# Altium schematic sheet Pressure_sensor_AFE1.SchDoc: =DT_SCH_Title
size A4; Organization: Droid Technologies; SheetNumber: 13; SheetTotal: 22
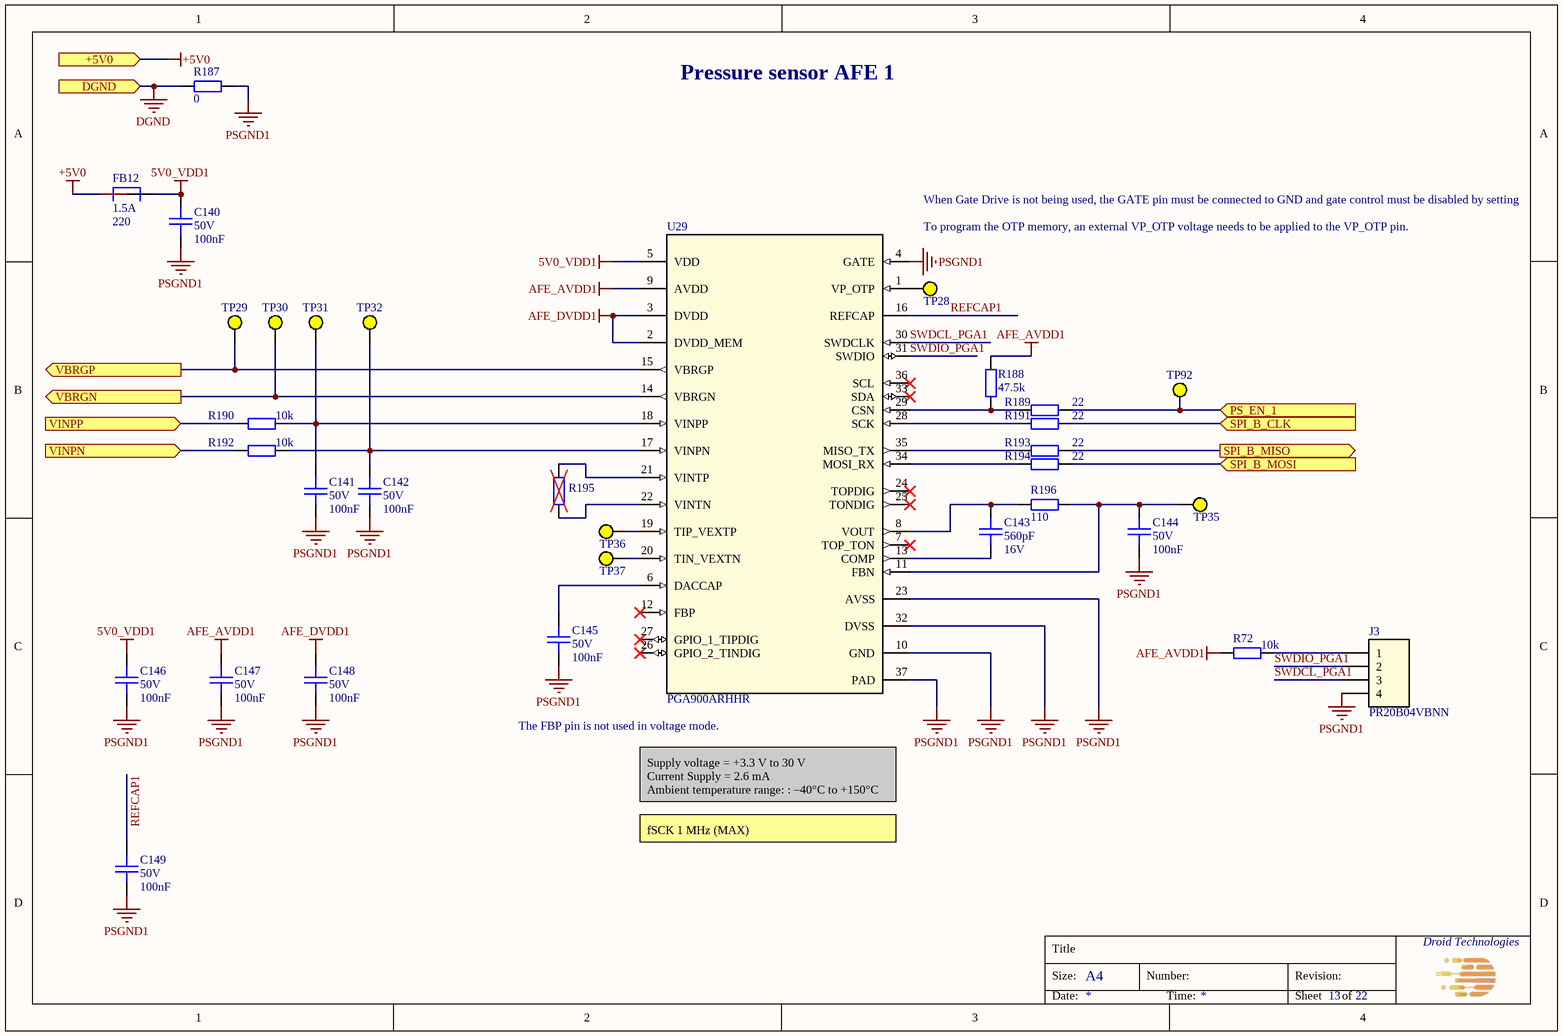
[diagram p0: Pressure_sensor_AFE1.SchDoc]

## Parts
C140  Voltage Rating: 50V  Capacitance: 100nF  [CAPC100x50x50L25]  (hidden comment: GCM155L8EH104KE07D)
C141  Voltage Rating: 50V  Capacitance: 100nF  [CAPC100x50x50L25]  (hidden comment: GCM155L8EH104KE07D)
C142  Voltage Rating: 50V  Capacitance: 100nF  [CAPC100x50x50L25]  (hidden comment: GCM155L8EH104KE07D)
C143  Capacitance: 560pF  Voltage Rating: 16V  [CAPC100x50x50L25]  (hidden comment: C0402C561F4HACAUTO)
C144  Voltage Rating: 50V  Capacitance: 100nF  [CAPC100x50x50L25]  (hidden comment: GCM155L8EH104KE07D)
C145  Voltage Rating: 50V  Capacitance: 100nF  [CAPC100x50x50L25]  (hidden comment: GCM155L8EH104KE07D)
C146  Voltage Rating: 50V  Capacitance: 100nF  [CAPC100x50x50L25]  (hidden comment: GCM155L8EH104KE07D)
C147  Voltage Rating: 50V  Capacitance: 100nF  [CAPC100x50x50L25]  (hidden comment: GCM155L8EH104KE07D)
C148  Voltage Rating: 50V  Capacitance: 100nF  [CAPC100x50x50L25]  (hidden comment: GCM155L8EH104KE07D)
C149  Voltage Rating: 50V  Capacitance: 100nF  [CAPC100x50x50L25]  (hidden comment: GCM155L8EH104KE07D)
FB12  Imax: 1.5A  Impedance: 220  [BEADC160X80X95L40]  (hidden comment: BLM18KG221BH1D)
J3  PR20B04VBNN  [M50-3530442]
R72  Resistance: 10k  [RESC100X50X40L25]  (hidden comment: RC0402FR-0710KL)
R187  Resistance: 0  [RESC160X80X55L30]  (hidden comment: RC0603FR-070RL)
R188  Resistance: 47.5k  [RESC100X50X40L25]  (hidden comment: RC0402FR-0747K5L)
R189  Resistance: 22  [RESC100X50X40L25]  (hidden comment: RC0402FR-0722RL)
R190  Resistance: 10k  [RESC100X50X40L25]  (hidden comment: RC0402FR-0710KL)
R191  Resistance: 22  [RESC100X50X40L25]  (hidden comment: RC0402FR-0722RL)
R192  Resistance: 10k  [RESC100X50X40L25]  (hidden comment: RC0402FR-0710KL)
R193  Resistance: 22  [RESC100X50X40L25]  (hidden comment: RC0402FR-0722RL)
R194  Resistance: 22  [RESC100X50X40L25]  (hidden comment: RC0402FR-0722RL)
R195  DNP chip res 0603  [RESC160X80X55L30]  (value not drawn)
R196  Resistance: 110  [RESC100X50X40L25]  (hidden comment: RC0402FR-07110RL)
TP28  Test Point  [TP_D1.5mm]  (value not drawn)  (no BOM)
TP29  Test Point  [TP_D0.75mm]  (value not drawn)  (no BOM)
TP30  Test Point  [TP_D0.75mm]  (value not drawn)  (no BOM)
TP31  Test Point  [TP_D0.75mm]  (value not drawn)  (no BOM)
TP32  Test Point  [TP_D0.75mm]  (value not drawn)  (no BOM)
TP35  Test Point  [TP_D0.75mm]  (value not drawn)  (no BOM)
TP36  Test Point  [TP_D1.5mm]  (value not drawn)  (no BOM)
TP37  Test Point  [TP_D1.5mm]  (value not drawn)  (no BOM)
TP92  Test Point  [TP_D0.75mm]  (value not drawn)  (no BOM)
U29  PGA900ARHHR  [36VQFN]

## Ports
+5V0 (in), DGND (in), PS_EN_1 (in), SPI_B_CLK (in), SPI_B_MISO (out), SPI_B_MOSI (in), VBRGN (out), VBRGP (out), VINPN (in), VINPP (in)

## Nets
5V0_VDD1: C140.2 C146.2 FB12.2 U29.5(VDD)
+5V0: FB12.1 ; port +5V0
AFE_AVDD1: C147.2 R72.2 R188.2 U29.9(AVDD)
AFE_DVDD1: C148.2 U29.2(DVDD_MEM) U29.3(DVDD)
DGND: R187.2 ; port DGND
PSGND1: C140.1 C141.1 C142.1 C144.1 C145.1 C146.1 C147.1 C148.1 C149.1 J3.4 R187.1 U29.4(GATE) U29.10(GND) U29.23(AVSS) U29.32(DVSS) U29.37(PAD)
PS_EN_1: R189.2 TP92.1 ; port PS_EN_1
REFCAP1: C149.2 U29.16(REFCAP)
SPI_B_CLK: R191.2 ; port SPI_B_CLK
SPI_B_MISO: R193.2 ; port SPI_B_MISO
SPI_B_MOSI: R194.2 ; port SPI_B_MOSI
SWDCL_PGA1: J3.3 U29.30(SWDCLK)
SWDIO_PGA1: J3.2 U29.31(SWDIO)
VBRGN: TP30.1 U29.14(VBRGN) ; port VBRGN
VBRGP: TP29.1 U29.15(VBRGP) ; port VBRGP
VINPN: R192.1 ; port VINPN
VINPP: R190.1 ; port VINPP
NetC141_2: C141.2 R190.2 TP31.1 U29.18(VINPP)
NetC142_2: C142.2 R192.2 TP32.1 U29.17(VINPN)
NetC143_1: C143.1 U29.13(COMP)
NetC143_2: C143.2 R196.1 U29.8(VOUT)
NetC144_2: C144.2 R196.2 TP35.1 U29.11(FBN)
NetC145_2: C145.2 U29.6(DACCAP)
NetJ3_1: J3.1 R72.1
NetR188_1: R188.1 R189.1 U29.29(CSN)
NetR191_1: R191.1 U29.28(SCK)
NetR193_1: R193.1 U29.35(MISO_TX)
NetR194_1: R194.1 U29.34(MOSI_RX)
NetR195_1: R195.1 U29.22(VINTN)
NetR195_2: R195.2 U29.21(VINTP)
NetTP28_1: TP28.1 U29.1(VP_OTP)
NetTP36_1: TP36.1 U29.19(TIP_VEXTP)
NetTP37_1: TP37.1 U29.20(TIN_VEXTN)

Not connected (* = marked no-connect by the designer): U29 7(TOP_TON)* 12(FBP)* 24(TOPDIG)* 25(TONDIG)* 26(GPIO_2_TINDIG)* 27(GPIO_1_TIPDIG)* 33(SDA)* 36(SCL)*

## Notes on the sheet
- Pressure sensor AFE 1
- To program the OTP memory, an external VP_OTP voltage needs to be applied to the VP_OTP pin.
- When Gate Drive is not being used, the GATE pin must be connected to GND and gate control must be disabled by setting
- (near U29) The FBP pin is not used in voltage mode.
- Supply voltage = +3.3 V to 30 V
  Current Supply = 2.6 mA
  Ambient temperature range: : –40°C to +150°C
- fSCK 1 MHz (MAX)
- Title
- Size:
- A4
- Number:
- Revision:
- Date:
- Time:
- Sheet
- of

## Library data of the parts
C140-C142 C144-C149 = CMP-001-1980-2: CAP CER 0.1UF 50V X8L 0402; Manufacturer: Murata Electronics; Op Temp max: 150°C; Op Temp min: -55°C; Tolerance: 10%; Height max: 550µm; ComponentLink3Description: Digikey; Mounting Type: SM; ComponentLink3URL: https://www.digikey.com/en/products/detail/murata-electronics/GCM155L8EH104KE07D/11618823; Package: 0402 (1005 Metric); Lead Spacing: 0mm; MPN: GCM155L8EH104KE07D; Size: 1.00mm x 0.50mm; Ratings: AEC-Q200; ComponentLink1URL: https://www.murata.com/en-us/products/productdetail?partno=GCM155L8EH104KE07%23; ComponentLink1Description: Datasheet; Dielectric: X8L; ComponentLink2Description: Mouser; ComponentLink2URL: https://eu.mouser.com/ProductDetail/Murata-Electronics/GCM155L8EH104KE07D?qs=1mbolxNpo8fQSHf0HYnZWw%3D%3D
C143 = CMP-001-2011-2: CAP CER 0402 560PF 16V ULTRA STA; Manufacturer: KEMET; Dielectric: X8R; Tolerance: 1%; Op Temp max: 150°C; Op Temp min: -55°C; Package: 0402 (1005 Metric); MPN: C0402C561F4HACAUTO; ComponentLink3Description: Digikey; Mounting Type: SM; Height max: 550µm; Lead Spacing: 0mm; ComponentLink1Description: Datasheet; ComponentLink3URL: https://www.digikey.com/en/products/detail/kemet/C0402C561F4HACAUTO/7955183?s=N4IgjCBcpgbFoDGUBmBDANgZwKYBoQB7KAbRAGYBOMAVgA4QBdAgBwBcoQBlNgJwEsAdgHMQAXwJgA7AhDJI6bPiKkQAFgBMGzfGYh2nHgJHiCGmhtnzFuAsUhltGyuQh6DkbnyGiJ4SnSUVqiYtioOIAAMTH4akWpB0HIhSnaqNLCRAAQsAGJMrByeAKqC-GwA8igAsjhoWACuvDimIAC0lknyfA3K9mQ0MbHpmSwoMUA; ComponentLink2URL: https://eu.mouser.com/ProductDetail/KEMET/C0402C561F4HACAUTO?qs=j%252B1pi9TdxUZljUlO6hXHJQ%3D%3D; ComponentLink2Description: Mouser; ComponentLink1URL: https://www.kemet.com/en/us/product/C0402C561F4HACAUTO.html; Ratings: AEC-Q200; Size: 1.00mm x 0.50mm
FB12 = CMP-001-1981-1: FERRITE BEAD 220 OHM 0603 1LN; Manufacturer: Murata Electronics; DCR: 50m; Op Temp min: -55°C; Frequency: 100MHz; Op Temp max: 150°C; Number of Lines: 1; Mounting Type: SM; Size: 1.60mm x 0.80mm; ComponentLink2URL: https://eu.mouser.com/ProductDetail/Murata-Electronics/BLM18KG221BH1D?qs=sJ5gq5MLFXpgEHYBdWUtkQ%3D%3D; ComponentLink1Description: Datasheet; ComponentLink1URL: https://www.murata.com/en-us/products/productdata/8798137286686/QNFA9129.pdf; Lead Spacing: 0mm; Ratings: AEC-Q200; ComponentLink3Description: Digikey; ComponentLink3URL: https://www.digikey.com/en/products/detail/murata-electronics/BLM18KG221BH1D/6156000; Height max: 950µm; Package: 0603 (1608 Metric); ComponentLink2Description: Mouser; MPN: BLM18KG221BH1D
J3 = M50-3530442: Connector Header Through Hole 4 position 0.050" (1.27mm); Manufacturer: METZ CONNECT USA Inc.; MPN: PR20B04VBNN; ComponentLink1Description: Datasheet; ComponentLink1URL: https://www.lcsc.com/datasheet/C3326047.pdf; ComponentLink2Description: DigiKey; ComponentLink2URL: https://www.digikey.com/en/products/detail/metz-connect-usa-inc/PR20B04VBNN/12342910
R72 R190 R192 = CMP-00010-6: RES 10K OHM 1% 1/16W 0402; Manufacturer: YAGEO; Op Temp max: 155°C; Op Temp min: -55°C; Power: 63mW; Temperature Coefficient: ±100ppm; ComponentLink3URL: https://www.digikey.com/en/products/detail/yageo/RC0402FR-0710KL/726523; ComponentLink1Description: Datasheet; Height max: 400µm; ComponentLink3Description: Digikey; ComponentLink2URL: https://www2.mouser.com/ProductDetail/YAGEO/RC0402FR-0710KL?qs=%2Fha2pyFaduhjtLcYvKXQ8NAGbRXkQ%2Fwl6RsvWHeV66MSeqLhkcF3rg%3D%3D; Ratings: -; MPN: RC0402FR-0710KL; ComponentLink1URL: https://www.yageo.com/upload/media/product/productsearch/datasheet/rchip/PYu-RC_Group_51_RoHS_L_12.pdf; ComponentLink2Description: Mouser; Mounting Type: SM; Tolerance: 1%; Composition: Thick Film; Size: 1.00mm x 0.50mm; Package: 0402 (1005 Metric)
R187 = CMP-001-0927-2: RES 0 OHM JUMPER 1/10W 0603; Manufacturer: YAGEO; Op Temp min: -55°C; Op Temp max: 155°C; Power: 100mW; Tolerance: 0%; Height max: 550µm; ComponentLink2URL: https://eu.mouser.com/ProductDetail/YAGEO/RC0603FR-070RL?qs=0yPvnVz5%2FmpDQv43TwvCfw%3D%3D; Temperature Coefficient: -; ComponentLink3Description: Digikey; ComponentLink2Description: Mouser; MPN: RC0603FR-070RL; ComponentLink1URL: https://www.yageo.com/upload/media/product/productsearch/datasheet/rchip/PYu-RC_Group_51_RoHS_L_12.pdf; Ratings: -; Size: 1.60mm x 0.80mm; Composition: Thick Film; Mounting Type: SM; ComponentLink3URL: https://www.digikey.com/en/products/detail/yageo/RC0603FR-070RL/1304008; Package: 0603 (1608 Metric); ComponentLink1Description: Datasheet
R188 = CMP-001-0277-7: RES 47.5K OHM 1% 1/16W 0402; Manufacturer: YAGEO; Op Temp min: -55°C; Power: 63mW; Temperature Coefficient: ±100ppm; Op Temp max: 155°C; ComponentLink1URL: https://www.yageo.com/upload/media/product/productsearch/datasheet/rchip/PYu-RC_Group_51_RoHS_L_12.pdf; ComponentLink1Description: Datasheet; MPN: RC0402FR-0747K5L; ComponentLink3Description: Digikey; ComponentLink2URL: https://eu.mouser.com/ProductDetail/YAGEO/RC0402FR-0747K5L?qs=V1yeUXFNrklfu86Rfgihxg%3D%3D; Mounting Type: SM; Tolerance: 1%; Package: 0402 (1005 Metric); Height max: 400µm; ComponentLink2Description: Mouser; ComponentLink3URL: https://www.digikey.com/en/products/detail/yageo/RC0402FR-0747K5L/726617; Size: 1.00mm x 0.50mm; Composition: Thick Film; Ratings: -
R189 R191 R193 R194 = CMP-001-0482-4: RES 22 OHM 1% 1/16W 0402; Manufacturer: YAGEO; Temperature Coefficient: ±100ppm; Op Temp max: 155°C; Op Temp min: -55°C; Power: 63mW; Ratings: -; ComponentLink3URL: https://www.digikey.com/en/products/detail/yageo/RC0402FR-0722RL/726562; ComponentLink2URL: https://eu.mouser.com/ProductDetail/YAGEO/RC0402FR-0722RL?qs=V1yeUXFNrkkRg6zf08ADKQ%3D%3D; MPN: RC0402FR-0722RL; ComponentLink1Description: Datasheet; ComponentLink3Description: Digikey; Tolerance: 1%; Size: 1.00mm x 0.50mm; ComponentLink1URL: https://www.yageo.com/upload/media/product/productsearch/datasheet/rchip/PYu-RC_Group_51_RoHS_L_12.pdf; Composition: Thick Film; ComponentLink2Description: Mouser; Mounting Type: SM; Package: 0402 (1005 Metric); Height max: 400µm
R195 = CMP-001-0920-3: DNP res 0603; Mounting Type: SM; MPN: DNP; Package: 0603 (1608 Metric)
R196 = CMP-001-0497-6: RES 110 OHM 1% 1/16W 0402; Manufacturer: YAGEO; Power: 63mW; Op Temp min: -55°C; Op Temp max: 155°C; Temperature Coefficient: ±100ppm; Size: 1.00mm x 0.50mm; ComponentLink1Description: Datasheet; Package: 0402 (1005 Metric); ComponentLink2URL: https://eu.mouser.com/ProductDetail/YAGEO/RC0402FR-07110RL?qs=QWYorlrD8IXj7iGvwWbRbA%3D%3D; MPN: RC0402FR-07110RL; ComponentLink3Description: Digikey; Height max: 400µm; Ratings: -; ComponentLink3URL: https://www.digikey.com/en/products/detail/yageo/RC0402FR-07110RL/2827583; Composition: Thick Film; ComponentLink2Description: Mouser; Tolerance: 1%; Mounting Type: SM; ComponentLink1URL: https://www.yageo.com/upload/media/product/productsearch/datasheet/rchip/PYu-RC_Group_51_RoHS_L_12.pdf
TP28 TP36 TP37 = TP_1.5
TP29-TP32 TP35 TP92 = TP_0.75: Test point 0.75mm
U29 = PGA900ARHHR: IC PROG SENSOR SGNL COND 36VQFN; Manufacturer: Texas Instruments; MPN: PGA900ARHHR